# Altium schematic sheet Digital_IN.SchDoc
size A3; ENG_APP_DATE: --/--/--; DSN_APP_DATE: --/--/--; CHK_APP_DATE: --/--/--
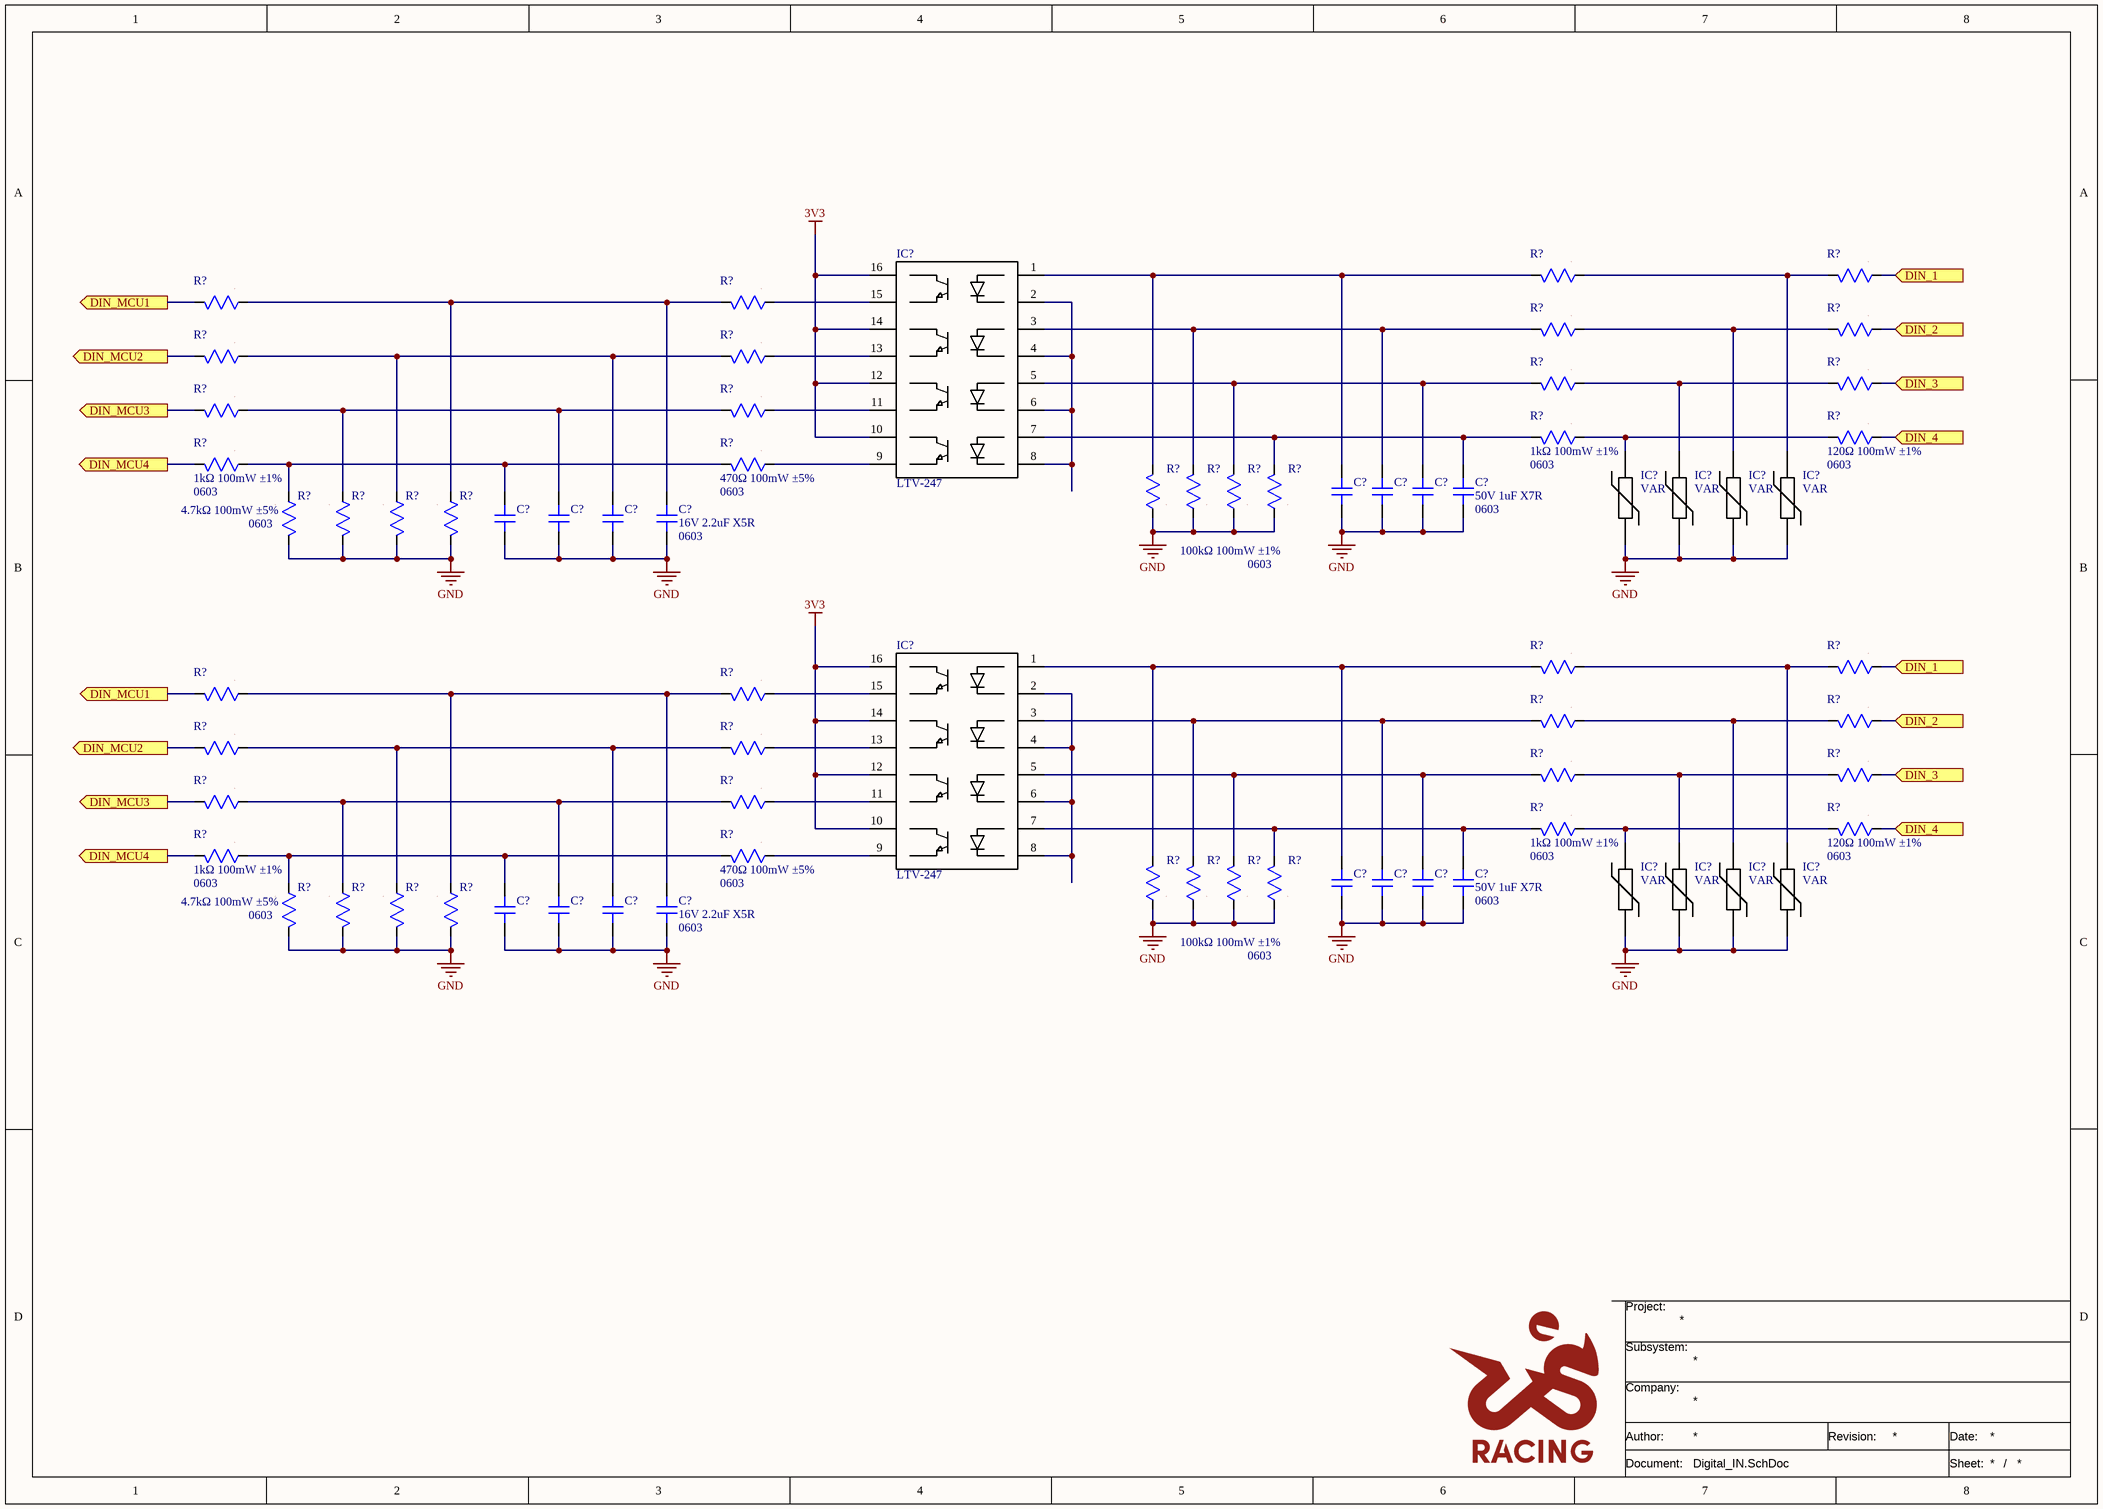
[diagram p0: Digital_IN.SchDoc]

## Parts
(Parts that share a designator on the sheet are numbered #1, #2 ... from top to bottom, then left to right.)
C?#1  CAP non polarized  [CAP SMD 0603]  (value not drawn)
C?#2  CAP non polarized  [CAP SMD 0603]  (value not drawn)
C?#3  CAP non polarized  [CAP SMD 0603]  (value not drawn)
C?#4  value 50V 1uF X7R  Package: 0603  [CAP SMD 0603]  (hidden comment: CAP non polarized)
C?#5  CAP non polarized  [CAP SMD 0603]  (value not drawn)
C?#6  CAP non polarized  [CAP SMD 0603]  (value not drawn)
C?#7  CAP non polarized  [CAP SMD 0603]  (value not drawn)
C?#8  value 16V 2.2uF X5R  Package: 0603  [CAP SMD 0603]  (hidden comment: CAP non polarized)
C?#9  CAP non polarized  [CAP SMD 0603]  (value not drawn)
C?#10  CAP non polarized  [CAP SMD 0603]  (value not drawn)
C?#11  CAP non polarized  [CAP SMD 0603]  (value not drawn)
C?#12  value 50V 1uF X7R  Package: 0603  [CAP SMD 0603]  (hidden comment: CAP non polarized)
C?#13  CAP non polarized  [CAP SMD 0603]  (value not drawn)
C?#14  CAP non polarized  [CAP SMD 0603]  (value not drawn)
C?#15  CAP non polarized  [CAP SMD 0603]  (value not drawn)
C?#16  value 16V 2.2uF X5R  Package: 0603  [CAP SMD 0603]  (hidden comment: CAP non polarized)
IC?#1  LTV-247  [SOP-16]
IC?#2  VAR  [VAR SMD 0805]
IC?#3  VAR  [VAR SMD 0805]
IC?#4  VAR  [VAR SMD 0805]
IC?#5  VAR  [VAR SMD 0805]
IC?#6  LTV-247  [SOP-16]
IC?#7  VAR  [VAR SMD 0805]
IC?#8  VAR  [VAR SMD 0805]
IC?#9  VAR  [VAR SMD 0805]
IC?#10  VAR  [VAR SMD 0805]
R?#1  RES  [RES SMD 0603]  (value not drawn)
R?#2  RES  [RES SMD 0603]  (value not drawn)
R?#3  RES  [RES SMD 0603]  (value not drawn)
R?#4  RES  [RES SMD 0603]  (value not drawn)
R?#5  RES  [RES SMD 0603]  (value not drawn)
R?#6  RES  [RES SMD 0603]  (value not drawn)
R?#7  RES  [RES SMD 0603]  (value not drawn)
R?#8  RES  [RES SMD 0603]  (value not drawn)
R?#9  RES  [RES SMD 0603]  (value not drawn)
R?#10  RES  [RES SMD 0603]  (value not drawn)
R?#11  RES  [RES SMD 0603]  (value not drawn)
R?#12  RES  [RES SMD 0603]  (value not drawn)
R?#13  value 1kΩ 100mW ±1%  Package: 0603  [RES SMD 0603]  (hidden comment: RES)
R?#14  value 120Ω 100mW ±1%  Package: 0603  [RES SMD 0603]  (hidden comment: RES)
R?#15  value 1kΩ 100mW ±1%  Package: 0603  [RES SMD 0603]  (hidden comment: RES)
R?#16  value 470Ω 100mW ±5%  Package: 0603  [RES SMD 0603]  (hidden comment: RES)
R?#17  value 100kΩ 100mW ±1%  Package: 0603  [RES SMD 0603]  (hidden comment: RES)
R?#18  RES  [RES SMD 0603]  (value not drawn)
R?#19  RES  [RES SMD 0603]  (value not drawn)
R?#20  RES  [RES SMD 0603]  (value not drawn)
R?#21  value 4.7kΩ 100mW ±5%  Package: 0603  [RES SMD 0603]  (hidden comment: RES)
R?#22  RES  [RES SMD 0603]  (value not drawn)
R?#23  RES  [RES SMD 0603]  (value not drawn)
R?#24  RES  [RES SMD 0603]  (value not drawn)
R?#25  RES  [RES SMD 0603]  (value not drawn)
R?#26  RES  [RES SMD 0603]  (value not drawn)
R?#27  RES  [RES SMD 0603]  (value not drawn)
R?#28  RES  [RES SMD 0603]  (value not drawn)
R?#29  RES  [RES SMD 0603]  (value not drawn)
R?#30  RES  [RES SMD 0603]  (value not drawn)
R?#31  RES  [RES SMD 0603]  (value not drawn)
R?#32  RES  [RES SMD 0603]  (value not drawn)
R?#33  RES  [RES SMD 0603]  (value not drawn)
R?#34  RES  [RES SMD 0603]  (value not drawn)
R?#35  RES  [RES SMD 0603]  (value not drawn)
R?#36  RES  [RES SMD 0603]  (value not drawn)
R?#37  value 1kΩ 100mW ±1%  Package: 0603  [RES SMD 0603]  (hidden comment: RES)
R?#38  value 120Ω 100mW ±1%  Package: 0603  [RES SMD 0603]  (hidden comment: RES)
R?#39  value 1kΩ 100mW ±1%  Package: 0603  [RES SMD 0603]  (hidden comment: RES)
R?#40  value 470Ω 100mW ±5%  Package: 0603  [RES SMD 0603]  (hidden comment: RES)
R?#41  value 100kΩ 100mW ±1%  Package: 0603  [RES SMD 0603]  (hidden comment: RES)
R?#42  RES  [RES SMD 0603]  (value not drawn)
R?#43  RES  [RES SMD 0603]  (value not drawn)
R?#44  RES  [RES SMD 0603]  (value not drawn)
R?#45  value 4.7kΩ 100mW ±5%  Package: 0603  [RES SMD 0603]  (hidden comment: RES)
R?#46  RES  [RES SMD 0603]  (value not drawn)
R?#47  RES  [RES SMD 0603]  (value not drawn)
R?#48  RES  [RES SMD 0603]  (value not drawn)

## Ports
DIN_1 (in), DIN_2 (in), DIN_3 (in), DIN_4 (in), DIN_MCU1 (out), DIN_MCU2 (out), DIN_MCU3 (out), DIN_MCU4 (out)

## Nets
3V3: IC?#1.10(C_4) IC?#1.12(C_3) IC?#1.14(C_2) IC?#1.16(C_1) IC?#6.10(C_4) IC?#6.12(C_3) IC?#6.14(C_2) IC?#6.16(C_1)
GND: C?#1.2 C?#2.2 C?#3.2 C?#4.2 C?#5.2 C?#6.2 C?#7.2 C?#8.2 C?#9.2 C?#10.2 C?#11.2 C?#12.2 C?#13.2 C?#14.2 C?#15.2 C?#16.2 IC?#2.1 IC?#3.1 IC?#4.1 IC?#5.1 IC?#7.1 IC?#8.1 IC?#9.1 IC?#10.1 R?#17.1 R?#18.1 R?#19.1 R?#20.1 R?#21.2 R?#22.2 R?#23.2 R?#24.2 R?#41.1 R?#42.1 R?#43.1 R?#44.1 R?#45.2 R?#46.2 R?#47.2 R?#48.2
DIN_1: R?#2.1 R?#26.1 ; port DIN_1
DIN_2: R?#6.1 R?#30.1 ; port DIN_2
DIN_3: R?#10.1 R?#34.1 ; port DIN_3
DIN_4: R?#14.1 R?#38.1 ; port DIN_4
DIN_MCU1: R?#3.2 R?#27.2 ; port DIN_MCU1
DIN_MCU2: R?#7.2 R?#31.2 ; port DIN_MCU2
DIN_MCU3: R?#11.2 R?#35.2 ; port DIN_MCU3
DIN_MCU4: R?#15.2 R?#39.2 ; port DIN_MCU4
NetC?#1_1: C?#1.1 IC?#1.1(A_1) R?#1.2 R?#17.2
NetC?#2_1: C?#2.1 IC?#1.3(A_2) R?#5.2 R?#18.2
NetC?#3_1: C?#3.1 IC?#1.5(A_3) R?#9.2 R?#19.2
NetC?#4_1: C?#4.1 IC?#1.7(A_4) R?#13.2 R?#20.2
NetC?#5_1: C?#5.1 R?#15.1 R?#16.2 R?#21.1
NetC?#6_1: C?#6.1 R?#11.1 R?#12.2 R?#22.1
NetC?#7_1: C?#7.1 R?#7.1 R?#8.2 R?#23.1
NetC?#8_1: C?#8.1 R?#3.1 R?#4.2 R?#24.1
NetC?#9_1: C?#9.1 IC?#6.1(A_1) R?#25.2 R?#41.2
NetC?#10_1: C?#10.1 IC?#6.3(A_2) R?#29.2 R?#42.2
NetC?#11_1: C?#11.1 IC?#6.5(A_3) R?#33.2 R?#43.2
NetC?#12_1: C?#12.1 IC?#6.7(A_4) R?#37.2 R?#44.2
NetC?#13_1: C?#13.1 R?#39.1 R?#40.2 R?#45.1
NetC?#14_1: C?#14.1 R?#35.1 R?#36.2 R?#46.1
NetC?#15_1: C?#15.1 R?#31.1 R?#32.2 R?#47.1
NetC?#16_1: C?#16.1 R?#27.1 R?#28.2 R?#48.1
NetIC?#1_2: IC?#1.2(K_1) IC?#1.4(K_2) IC?#1.6(K_3) IC?#1.8(K_4)
NetIC?#1_9: IC?#1.9(E_4) R?#16.1
NetIC?#1_11: IC?#1.11(E_3) R?#12.1
NetIC?#1_13: IC?#1.13(E_2) R?#8.1
NetIC?#1_15: IC?#1.15(E_1) R?#4.1
NetIC?#2_2: IC?#2.2 R?#13.1 R?#14.2
NetIC?#3_2: IC?#3.2 R?#9.1 R?#10.2
NetIC?#4_2: IC?#4.2 R?#5.1 R?#6.2
NetIC?#5_2: IC?#5.2 R?#1.1 R?#2.2
NetIC?#6_2: IC?#6.2(K_1) IC?#6.4(K_2) IC?#6.6(K_3) IC?#6.8(K_4)
NetIC?#6_9: IC?#6.9(E_4) R?#40.1
NetIC?#6_11: IC?#6.11(E_3) R?#36.1
NetIC?#6_13: IC?#6.13(E_2) R?#32.1
NetIC?#6_15: IC?#6.15(E_1) R?#28.1
NetIC?#7_2: IC?#7.2 R?#37.1 R?#38.2
NetIC?#8_2: IC?#8.2 R?#33.1 R?#34.2
NetIC?#9_2: IC?#9.2 R?#29.1 R?#30.2
NetIC?#10_2: IC?#10.2 R?#25.1 R?#26.2

## Notes on the sheet
- Project:
- Subsystem:
- Company:
- Document:
- Author:
- Revision:
- Date:
- Sheet:
- /

## Library data of the parts
C?#1-C?#3 C?#9-C?#11 = 001-0102: Condensadores de cerámica multicapa (MLCC- SMD/SMT) WCAP-CSGP 1uF 50 Vol 10%; MPN: 885012206126; Manufacturer: Wurth Elektronik; Value: 50V 1uF X7R; ComponentLink1Description: Datasheet; ComponentLink1URL: https://www.we-online.com/components/products/datasheet/885012206126.pdf; ComponentLink2Description: Distributor Link; ComponentLink2URL: https://www.mouser.es/ProductDetail/Wurth-Elektronik/885012206126?qs=amGC7iS6iy%2F%252BJOLb%2FSuwig%3D%3D; Package: 0603; ID: 001-0102; Distributor PN: 710-885012206126; Distributor: Mouser
C?#4 C?#12 = 001-0102: Condensadores de cerámica multicapa (MLCC- SMD/SMT) WCAP-CSGP 1uF 50 Vol 10%; MPN: 885012206126; Manufacturer: Wurth Elektronik; ComponentLink1Description: Datasheet; ComponentLink1URL: https://www.we-online.com/components/products/datasheet/885012206126.pdf; ComponentLink2Description: Distributor Link; ComponentLink2URL: https://www.mouser.es/ProductDetail/Wurth-Elektronik/885012206126?qs=amGC7iS6iy%2F%252BJOLb%2FSuwig%3D%3D; ID: 001-0102; Distributor PN: 710-885012206126; Distributor: Mouser
C?#5-C?#7 C?#13-C?#15 = 001-0113: Condensadores de cerámica multicapa (MLCC- SMD/SMT) WCAP-CSGP 2.2uF 16V 10%; MPN: 885012106029; Manufacturer: Wurth Elektronik; Value: 16V 2.2uF X5R; ComponentLink1Description: Datasheet; ComponentLink1URL: https://www.we-online.com/components/products/datasheet/885012106029.pdf; ComponentLink2Description: Distributor Link; ComponentLink2URL: https://www.mouser.es/ProductDetail/Wurth-Elektronik/885012106029?qs=amGC7iS6iy%252BgG3I4L92Nqg%3D%3D; Package: 0603; ID: 001-0113; Distributor PN: 710-885012106029; Distributor: Mouser
C?#8 C?#16 = 001-0113: Condensadores de cerámica multicapa (MLCC- SMD/SMT) WCAP-CSGP 2.2uF 16V 10%; MPN: 885012106029; Manufacturer: Wurth Elektronik; ComponentLink1Description: Datasheet; ComponentLink1URL: https://www.we-online.com/components/products/datasheet/885012106029.pdf; ComponentLink2Description: Distributor Link; ComponentLink2URL: https://www.mouser.es/ProductDetail/Wurth-Elektronik/885012106029?qs=amGC7iS6iy%252BgG3I4L92Nqg%3D%3D; ID: 001-0113; Distributor PN: 710-885012106029; Distributor: Mouser
IC?#1 IC?#6 = 041-0002: Optoacopladores para salidas de transistores PTR 50% 5KV 16 PIN 4CH Optocoupler; Manufacturer: LITEON; ComponentLink1Description: Datasheet; ComponentLink1URL: https://www.mouser.com/catalog/specsheets/Lite-On-07-31-2018-LTV-2X7%20sereis%20Apr18.pdf?_gl=1*hv8h7o*_gcl_aw*R0NMLjE3ODA5NDM2MTUuQ2owS0NRancwSm5SQmhESkFSSXNBTG9iblhiTVZmV3NWb0pqSGVpNWRkTXk2SzRuNEhwRGVRWXYxa0dMT0s1N0VWSjRWQlE1eFhBYUoxd2FBa3NuRUFMd193Y0I.*_gcl_au*MjAyMjI4MzgwOS4xNzc1NDk0ODAwLjEzNjA3ODI2NzguMTc4MzExMDAxNi4xNzgzMTEwMDE2*_ga*Nzg3Njk5NTY0LjE3NDY2Mzg0MjI.*_ga_15W4STQT4T*czE3ODMxMTAwMTYkbzEzNyRnMSR0MTc4MzExMDAxOSRqNTckbDAkaDA.; ComponentLink2Description: Distributor Link; ComponentLink2URL: https://www.mouser.es/ProductDetail/LITEON/LTV-247?qs=9ayhpukWNmvWpoxQBzWkFA%3D%3D; ID: 041-0002; Value: -; Package: SOP-16; MPN: LTV-247; Distributor PN: 859-LTV-247; Distributor: Mouser
IC?#2-IC?#5 IC?#7-IC?#10 = 036-0002: Varistores 18 VDC .3J 44V-CL 120A PK; MPN: V18MLA0805NH; Manufacturer: Littlefuse; Value: 18V 120A 520pF; ComponentLink1Description: Datasheet; ComponentLink1URL: https://www.littelfuse.com/assetdocs/littelfuse_varistor_mla_datasheet.pdf?assetguid=7092c93f-7453-48dd-8345-d10368b54a20; ComponentLink2Description: Distributor Link; ComponentLink2URL: https://www.mouser.es/es/ProductDetail/Littelfuse/V18MLA0805NH?qs=slssyL07VvNBxGr5IH4W1g%3D%3D; ID: 036-0002; Package: 0805; Distributor PN: 576-V18MLA0805NH; Distributor: Mouser
R?#1 R?#3 R?#5 R?#7 R?#9 R?#11 R?#25 R?#27 R?#29 R?#31 R?#33 R?#35 = 010-0170: Thick Film Resistors WRIS-RSKS 1 kOhms 1 % 0.1 W 0603 AEC-Q200; MPN: 560112116014; Manufacturer: Wurth Elektronik; Value: 1kΩ 100mW ±1%; ComponentLink1Description: Datasheet; ComponentLink1URL: https://www.we-online.com/components/products/datasheet/560112116014.pdf; ComponentLink2Description: Distributor Link; ComponentLink2URL: https://www.mouser.es/ProductDetail/Wurth-Elektronik/560112116014?qs=sGAEpiMZZMvdGkrng054txLI%2FDB4oIKD92viHLDiYpSVemZawWv4yQ%3D%3D; Package: 0603; ID: 010-0170; Distributor PN: 710-560112116014; Distributor: Mouser
R?#2 R?#6 R?#10 R?#26 R?#30 R?#34 = 010-0177: Resistores de película gruesa - SMD WRIS-RSKS 120 Ohms 1 % 0.1 W 0603 AEC-Q200; MPN: 560112116119; Manufacturer: Wurth Elektronik; Value: 120Ω 100mW ±1%; ComponentLink1Description: Datasheet; ComponentLink1URL: https://www.we-online.com/components/products/datasheet/560112116119.pdf; ComponentLink2Description: Distributor Link; ComponentLink2URL: https://www.mouser.es/ProductDetail/Wurth-Elektronik/560112116119?qs=mELouGlnn3eT%2F22oIMY8Ng%3D%3D; Package: 0603; ID: 010-0177; Distributor PN: 710-560112116119; Distributor: Mouser
R?#4 R?#8 R?#12 R?#28 R?#32 R?#36 = 010-0187: Thick Film Resistors WRIS-RSKS 470 Ohms 5 % 0.1 W 0603 AEC-Q200; MPN: 560112116031; Manufacturer: Wurth Elektronik; Value: 470Ω 100mW ±5%; ComponentLink1Description: Datasheet; ComponentLink1URL: https://www.we-online.com/components/products/datasheet/560112116031.pdf; ComponentLink2Description: Distributor Link; ComponentLink2URL: https://www.mouser.es/ProductDetail/Wurth-Elektronik/560112116031?qs=sGAEpiMZZMvdGkrng054t2cqbZCzJY7Nc63jNcSJ2mNzAJgQFdfNBw%3D%3D; Package: 0603; ID: 010-0187; Distributor PN: 710-560112116031; Distributor: Mouser
R?#13 R?#15 R?#37 R?#39 = 010-0170: Thick Film Resistors WRIS-RSKS 1 kOhms 1 % 0.1 W 0603 AEC-Q200; MPN: 560112116014; Manufacturer: Wurth Elektronik; ComponentLink1Description: Datasheet; ComponentLink1URL: https://www.we-online.com/components/products/datasheet/560112116014.pdf; ComponentLink2Description: Distributor Link; ComponentLink2URL: https://www.mouser.es/ProductDetail/Wurth-Elektronik/560112116014?qs=sGAEpiMZZMvdGkrng054txLI%2FDB4oIKD92viHLDiYpSVemZawWv4yQ%3D%3D; ID: 010-0170; Distributor PN: 710-560112116014; Distributor: Mouser
R?#14 R?#38 = 010-0177: Resistores de película gruesa - SMD WRIS-RSKS 120 Ohms 1 % 0.1 W 0603 AEC-Q200; MPN: 560112116119; Manufacturer: Wurth Elektronik; ComponentLink1Description: Datasheet; ComponentLink1URL: https://www.we-online.com/components/products/datasheet/560112116119.pdf; ComponentLink2Description: Distributor Link; ComponentLink2URL: https://www.mouser.es/ProductDetail/Wurth-Elektronik/560112116119?qs=mELouGlnn3eT%2F22oIMY8Ng%3D%3D; ID: 010-0177; Distributor PN: 710-560112116119; Distributor: Mouser
R?#16 R?#40 = 010-0187: Thick Film Resistors WRIS-RSKS 470 Ohms 5 % 0.1 W 0603 AEC-Q200; MPN: 560112116031; Manufacturer: Wurth Elektronik; ComponentLink1Description: Datasheet; ComponentLink1URL: https://www.we-online.com/components/products/datasheet/560112116031.pdf; ComponentLink2Description: Distributor Link; ComponentLink2URL: https://www.mouser.es/ProductDetail/Wurth-Elektronik/560112116031?qs=sGAEpiMZZMvdGkrng054t2cqbZCzJY7Nc63jNcSJ2mNzAJgQFdfNBw%3D%3D; ID: 010-0187; Distributor PN: 710-560112116031; Distributor: Mouser
R?#17 R?#41 = 010-0190: Thick Film Resistors WRIS-RSKS 100 kOhms 1 % 0.1 W 0603 AEC-Q200; MPN: 560112116004; Manufacturer: Wurth Elektronik; ComponentLink1Description: Datasheet; ComponentLink1URL: https://www.we-online.com/components/products/datasheet/560112116004.pdf; ComponentLink2Description: Distributor Link; ComponentLink2URL: https://www.mouser.es/ProductDetail/Wurth-Elektronik/560112116004?qs=sGAEpiMZZMvdGkrng054txLI%2FDB4oIKDB%252BmfBE1ySSGuQklCN21gzA%3D%3D; ID: 010-0190; Distributor PN: 710-560112116004; Distributor: Mouser
R?#18-R?#20 R?#42-R?#44 = 010-0190: Thick Film Resistors WRIS-RSKS 100 kOhms 1 % 0.1 W 0603 AEC-Q200; MPN: 560112116004; Manufacturer: Wurth Elektronik; Value: 100kΩ 100mW ±1%; ComponentLink1Description: Datasheet; ComponentLink1URL: https://www.we-online.com/components/products/datasheet/560112116004.pdf; ComponentLink2Description: Distributor Link; ComponentLink2URL: https://www.mouser.es/ProductDetail/Wurth-Elektronik/560112116004?qs=sGAEpiMZZMvdGkrng054txLI%2FDB4oIKDB%252BmfBE1ySSGuQklCN21gzA%3D%3D; Package: 0603; ID: 010-0190; Distributor PN: 710-560112116004; Distributor: Mouser
R?#21 R?#45 = 010-0188: Thick Film Resistors WRIS-RSKS 4.7 kOhms 5 % 0.1 W 0402 AEC-Q200; MPN: 560112110018; Manufacturer: Wurth Elektronik; ComponentLink1Description: Datasheet; ComponentLink1URL: https://www.we-online.com/components/products/datasheet/560112110018.pdf; ComponentLink2Description: Distributor Link; ComponentLink2URL: https://www.mouser.es/ProductDetail/Wurth-Elektronik/560112110018?qs=sGAEpiMZZMvdGkrng054txLI%2FDB4oIKDXtogfAbE0Wc%252BspLjErwG3g%3D%3D; ID: 010-0188; Distributor PN: 710-560112110018; Distributor: Mouser
R?#22-R?#24 R?#46-R?#48 = 010-0188: Thick Film Resistors WRIS-RSKS 4.7 kOhms 5 % 0.1 W 0402 AEC-Q200; MPN: 560112110018; Manufacturer: Wurth Elektronik; Value: 4.7kΩ 100mW ±5%; ComponentLink1Description: Datasheet; ComponentLink1URL: https://www.we-online.com/components/products/datasheet/560112110018.pdf; ComponentLink2Description: Distributor Link; ComponentLink2URL: https://www.mouser.es/ProductDetail/Wurth-Elektronik/560112110018?qs=sGAEpiMZZMvdGkrng054txLI%2FDB4oIKDXtogfAbE0Wc%252BspLjErwG3g%3D%3D; Package: 0603; ID: 010-0188; Distributor PN: 710-560112110018; Distributor: Mouser